# Altium schematic sheet MCU_SLAVE.SchDoc
size A4; SheetNumber: 6; SheetTotal: 6
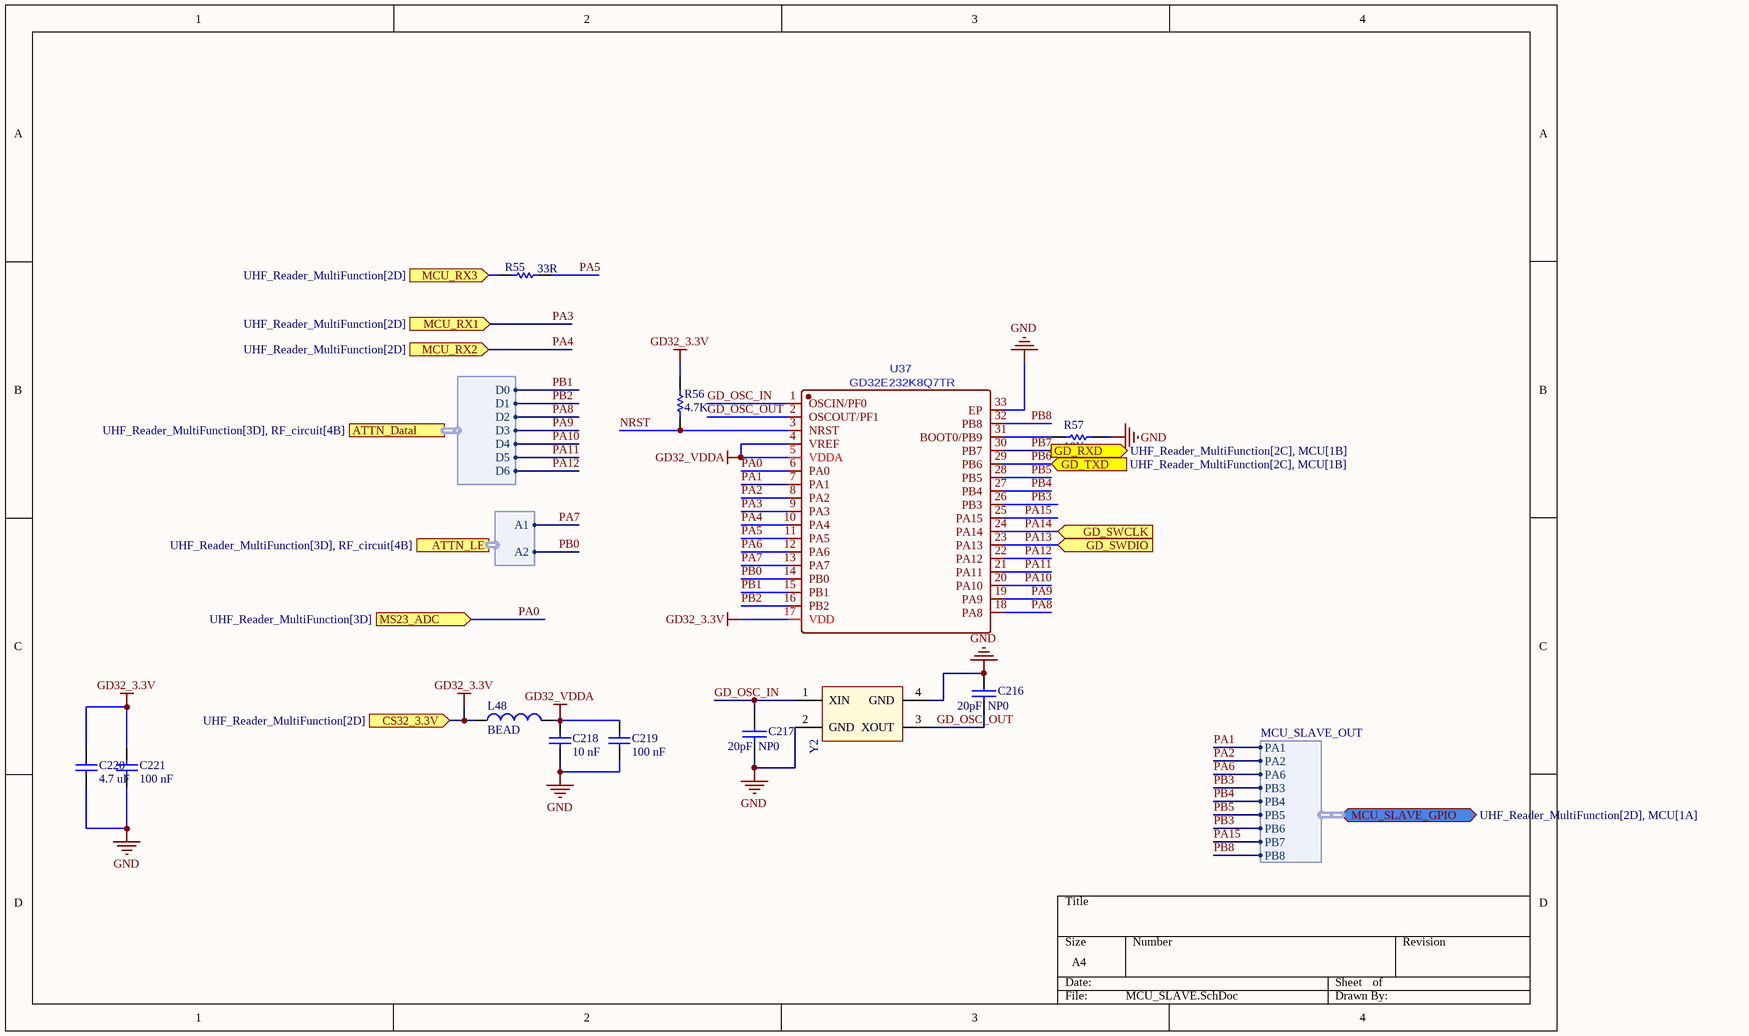
[diagram p0: MCU_SLAVE.SchDoc]

## Parts
C216  20pF  NP0  [0402_Z]
C217  20pF  NP0  [0402_Z]
C218  10 nF  [0402_Z]
C219  100 nF  [0402_Z]
C220  4.7 uF  [0603_Z]
C221  100 nF  [0402_Z]
L48  BEAD  [0603_Z]
R55  33R  [0402_Z]
R56  4.7K  [0402_Z]
R57  10K  [0402_Z]
U37  GD32E232K8Q7TR  [QFN-32_L4.0-W4.0-P0.40-TL-EP2.8]
Y2  48MHz无源晶振  [XTAL_2520]  (value not drawn)

## Ports
ATTN_Datal (harness ATTN1, see UHF_Reader_MultiFunction[3D], RF_circuit[4B]), ATTN_LE (harness ATTN_LE, see UHF_Reader_MultiFunction[3D], RF_circuit[4B]), CS32_3.3V (in, see UHF_Reader_MultiFunction[2D]), GD_RXD (out, see UHF_Reader_MultiFunction[2C], MCU[1B]), GD_SWCLK (in, see UHF_Reader_MultiFunction[2D], MCU[1B]), GD_SWDIO (in, see UHF_Reader_MultiFunction[2D]), GD_TXD (in, see UHF_Reader_MultiFunction[2C], MCU[1B]), MCU_RX1 (in, see UHF_Reader_MultiFunction[2D]), MCU_RX2 (in, see UHF_Reader_MultiFunction[2D]), MCU_RX3 (in, see UHF_Reader_MultiFunction[2D]), MCU_SLAVE_GPIO (bidir, harness MCU_SLAVE_OUT, see UHF_Reader_MultiFunction[2D], MCU[1A]), MS23_ADC (in, see UHF_Reader_MultiFunction[3D])

## Harnesses
ATTN1: D0, D1, D2, D3, D4, D5, D6
ATTN_LE: A1, A2
MCU_SLAVE_OUT: PA1, PA2, PA6, PB3, PB4, PB5, PB6, PB7, PB8

## Nets
GD32_3.3V: C220.2 C221.2 L48.1 R56.2 U37.17(VDD) ; port CS32_3.3V
GD32_VDDA: C218.2 C219.2 L48.2 U37.4(VREF) U37.5(VDDA)
GND: C216.2 C217.1 C218.1 C219.1 C220.1 C221.1 R57.1 U37.33(EP) Y2.2(GND) Y2.4(GND)
GD_OSC_IN: C217.2 U37.1(OSCIN/PF0) Y2.1(XIN)
GD_OSC_OUT: C216.1 U37.2(OSCOUT/PF1) Y2.3(XOUT)
MCU_RX3: R55.2 ; port MCU_RX3
NRST: R56.1 U37.3(NRST)
PA0: U37.6(PA0) ; port MS23_ADC
PA1: U37.7(PA1) ; port MCU_SLAVE_GPIO.PA1
PA2: U37.8(PA2) ; port MCU_SLAVE_GPIO.PA2
PA3: U37.9(PA3) ; port MCU_RX1
PA4: U37.10(PA4) ; port MCU_RX2
PA5: R55.1 U37.11(PA5)
PA6: U37.12(PA6) ; port MCU_SLAVE_GPIO.PA6
PA7: U37.13(PA7) ; port ATTN_LE.A1
PA8: U37.18(PA8) ; port ATTN_Datal.D2
PA9: U37.19(PA9) ; port ATTN_Datal.D3
PA10: U37.20(PA10) ; port ATTN_Datal.D4
PA11: U37.21(PA11) ; port ATTN_Datal.D5
PA12: U37.22(PA12) ; port ATTN_Datal.D6
PA13: U37.23(PA13) ; port GD_SWDIO
PA14: U37.24(PA14) ; port GD_SWCLK
PA15: U37.25(PA15) ; port MCU_SLAVE_GPIO.PB7
PB0: U37.14(PB0) ; port ATTN_LE.A2
PB1: U37.15(PB1) ; port ATTN_Datal.D0
PB2: U37.16(PB2) ; port ATTN_Datal.D1
PB3: U37.26(PB3) ; port MCU_SLAVE_GPIO.PB3, port MCU_SLAVE_GPIO.PB6
PB4: U37.27(PB4) ; port MCU_SLAVE_GPIO.PB4
PB5: U37.28(PB5) ; port MCU_SLAVE_GPIO.PB5
PB6: U37.29(PB6) ; port GD_TXD
PB7: U37.30(PB7) ; port GD_RXD
PB8: U37.32(PB8) ; port MCU_SLAVE_GPIO.PB8
NetR57_2: R57.2 U37.31(BOOT0/PB9)

## Library data of the parts
C216 C217 = CAP: 0402; Value: 20pF  NP0
C218-C221 = Cap: Capacitor; Value: 100pF; Published: 8-Jun-2000; LatestRevisionDate: 17-Jul-2002; LatestRevisionNote: Re-released for DXP Platform.; PackageReference: RAD-0.3; Publisher: Altium Limited; PackageDescription: Radial Cap, Thru-Hole; 2 Leads; 0.3 in Pin Spacing
L48 = Inductor: Code_IEC: 1005; Value: 10mH; Published: 8-Jun-2000; LatestRevisionDate: 29-May-2009; LatestRevisionNote: IPC-7351 Footprint Added.; PackageReference: 0402-A; Publisher: Altium Limited; PackageDescription: Chip Inductor; Code_JEITA: 0402
R55 = Res: 0402; Value: 100R; Published: 8-Jun-2000; Revision: July-2002: Re-released for DXP Platform.; Publisher: Altium Limited
R56 R57 = Res1: Resistor; Value: 1K; Published: 8-Jun-2000; LatestRevisionDate: 17-Jul-2002; LatestRevisionNote: Re-released for DXP Platform.; PackageReference: AXIAL-0.3; Publisher: Altium Limited; PackageDescription: Axial Device, Thru-Hole; 2 Leads; 0.3 in Pin Spacing
Y2 = XTAL 3225: PCB DECAL: 3225; Source_Path: E:\LI LELE\DESIGN KIT\DESIGN KIT_ESP8089_DEMO\ESP8089_DEMO.DSN